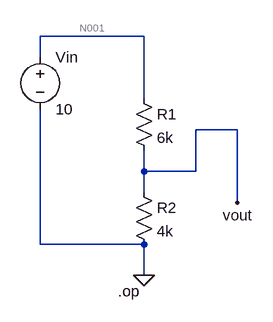
[diagram p0: schematic Day1_Voltage_Divider.asc]
Day1_Voltage_Divider.asc, the LTspice schematic file:
Version 4.1
SHEET 1 880 680
WIRE 160 -16 0 -16
WIRE 0 16 0 -16
WIRE 160 80 160 -16
WIRE 304 128 240 128
WIRE 160 192 160 160
WIRE 240 192 240 128
WIRE 240 192 160 192
WIRE 160 224 160 192
WIRE 304 240 304 128
WIRE 0 304 0 96
WIRE 160 304 0 304
WIRE 160 352 160 304
FLAG 160 352 0
FLAG 304 240 vout
SYMBOL res 144 64 R0
SYMATTR InstName R1
SYMATTR Value 6k
SYMBOL res 144 208 R0
SYMATTR InstName R2
SYMATTR Value 4k
SYMBOL voltage 0 0 R0
SYMATTR InstName Vin
SYMATTR Value 10
TEXT 120 376 Left 2 !.op

The netlist it stands for:
* Day1_Voltage_Divider.asc
R1 N001 vout 6k
R2 vout 0 4k
Vin N001 0 10
.op
.backanno
.end

* Results of the author's LTspice run, read from the files saved beside the schematic
* Operating Point:
*   V(n001) = 10 V
*   V(vout) = 4 V
*   I(R1) = 1 mA
*   I(R2) = 1 mA
*   I(Vin) = -1 mA